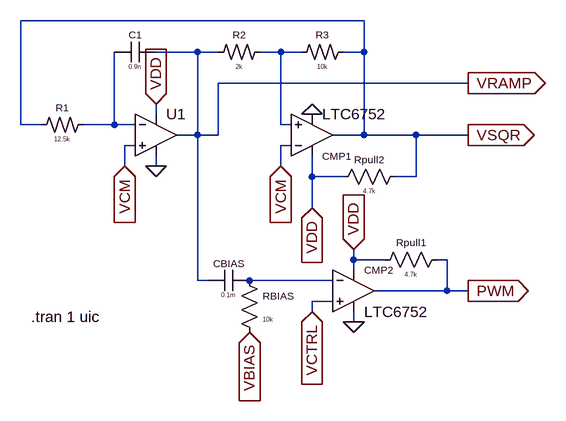
[diagram p0: schematic exp1-block.asc]
exp1-block.asc, the LTspice schematic file:
Version 4
SHEET 1 1052 944
WIRE 560 304 32 304
WIRE 304 352 240 352
WIRE 336 352 304 352
WIRE 432 352 400 352
WIRE 464 352 432 352
WIRE 560 352 560 304
WIRE 560 352 528 352
WIRE 720 400 336 400
WIRE 240 448 240 432
WIRE 32 464 32 304
WIRE 64 464 32 464
WIRE 176 464 176 352
WIRE 176 464 128 464
WIRE 208 464 176 464
WIRE 432 464 432 352
WIRE 448 464 432 464
WIRE 304 480 304 352
WIRE 304 480 272 480
WIRE 336 480 336 400
WIRE 336 480 304 480
WIRE 560 480 560 352
WIRE 560 480 512 480
WIRE 640 480 560 480
WIRE 720 480 640 480
WIRE 208 496 192 496
WIRE 448 496 432 496
WIRE 192 528 192 496
WIRE 240 528 240 512
WIRE 432 528 432 496
WIRE 480 544 480 512
WIRE 528 544 480 544
WIRE 640 544 640 480
WIRE 640 544 608 544
WIRE 480 592 480 544
WIRE 544 672 544 656
WIRE 592 672 544 672
WIRE 688 672 672 672
WIRE 544 688 544 672
WIRE 304 704 304 480
WIRE 320 704 304 704
WIRE 512 704 384 704
WIRE 688 720 688 672
WIRE 688 720 576 720
WIRE 720 720 688 720
WIRE 512 736 480 736
WIRE 480 752 480 736
WIRE 544 768 544 752
FLAG 240 432 VDD
IOPIN 240 432 In
FLAG 544 768 0
FLAG 480 448 0
FLAG 240 528 0
FLAG 720 480 VSQR
IOPIN 720 480 Out
FLAG 720 720 PWM
IOPIN 720 720 Out
FLAG 480 752 VCTRL
IOPIN 480 752 In
FLAG 192 528 VCM
IOPIN 192 528 In
FLAG 432 528 VCM
IOPIN 432 528 In
FLAG 480 592 VDD
IOPIN 480 592 In
FLAG 544 656 VDD
IOPIN 544 656 In
FLAG 720 400 VRAMP
IOPIN 720 400 Out
FLAG 384 784 VBIAS
IOPIN 384 784 In
SYMBOL res2 528 336 R90
WINDOW 0 0 32 VBottom 1
WINDOW 3 32 32 VTop 0
SYMATTR InstName R3
SYMATTR Value 10k
SYMBOL res2 128 448 R90
WINDOW 0 0 32 VBottom 1
WINDOW 3 32 32 VTop 0
SYMATTR InstName R1
SYMATTR Value 12.5k
SYMBOL cap 240 336 R90
WINDOW 0 0 32 VBottom 1
WINDOW 3 32 32 VTop 0
SYMATTR InstName C1
SYMATTR Value 0.9n
SYMBOL res2 400 336 R90
WINDOW 0 0 32 VBottom 1
WINDOW 3 32 32 VTop 0
SYMATTR InstName R2
SYMATTR Value 2k
SYMBOL res 576 688 R270
WINDOW 0 32 56 VTop 1
WINDOW 3 0 56 VBottom 0
SYMATTR InstName Rpull1
SYMATTR Value 4.7k
SYMBOL cap 384 688 R90
WINDOW 0 0 32 VBottom 1
WINDOW 3 32 32 VTop 0
SYMATTR InstName CBIAS
SYMATTR Value 0.1m
SYMBOL res 368 688 R0
WINDOW 0 36 40 Left 1
WINDOW 3 36 76 Left 0
SYMATTR InstName RBIAS
SYMATTR Value 10k
SYMBOL res 624 528 R90
WINDOW 0 0 56 VBottom 1
WINDOW 3 32 56 VTop 0
SYMATTR InstName Rpull2
SYMATTR Value 4.7k
SYMBOL Comparators/LTC6752 544 656 R0
WINDOW 0 16 32 Left 1
SYMATTR InstName CMP2
SYMBOL Comparators/LTC6752 480 544 M180
WINDOW 0 16 32 Left 1
SYMATTR InstName CMP1
SYMBOL Opamps/UniversalOpamp2 240 480 R0
SYMATTR InstName U1
TEXT 48 760 Left 2 !.tran 1 uic

The netlist it stands for:
* exp1-block.asc
R3 VSQR N001 10k
R1 N002 VSQR 12.5k
C1 VRAMP N002 0.9n
R2 N001 VRAMP 2k
Rpull1 VDD PWM 4.7k
CBIAS N003 VRAMP 0.1m
RBIAS N003 VBIAS 10k
Rpull2 VSQR VDD 4.7k
XCMP2 VCTRL N003 VDD 0 PWM LTC6752  ; pins In+ In- V+ V- OUT
XCMP1 N001 VCM VDD 0 VSQR LTC6752  ; pins In+ In- V+ V- OUT
XU1 VCM N002 VDD 0 VRAMP level.2 Avol=1Meg GBW=10Meg Slew=10Meg ilimit=25m rail=0 Vos=0 phimargin=45 en=0 enk=0 in=0 ink=0 Rin=500Meg  ; pins IN+ IN- V+ V- OUT
.tran 1 uic
.lib LTC7.lib
.lib UniversalOpamps2.sub
.backanno
.end